# Altium schematic sheet Control-Sheet.SchDoc (part 1 of 3)
size 420 x 297 mm; SheetNumber: 4; SheetTotal: 4
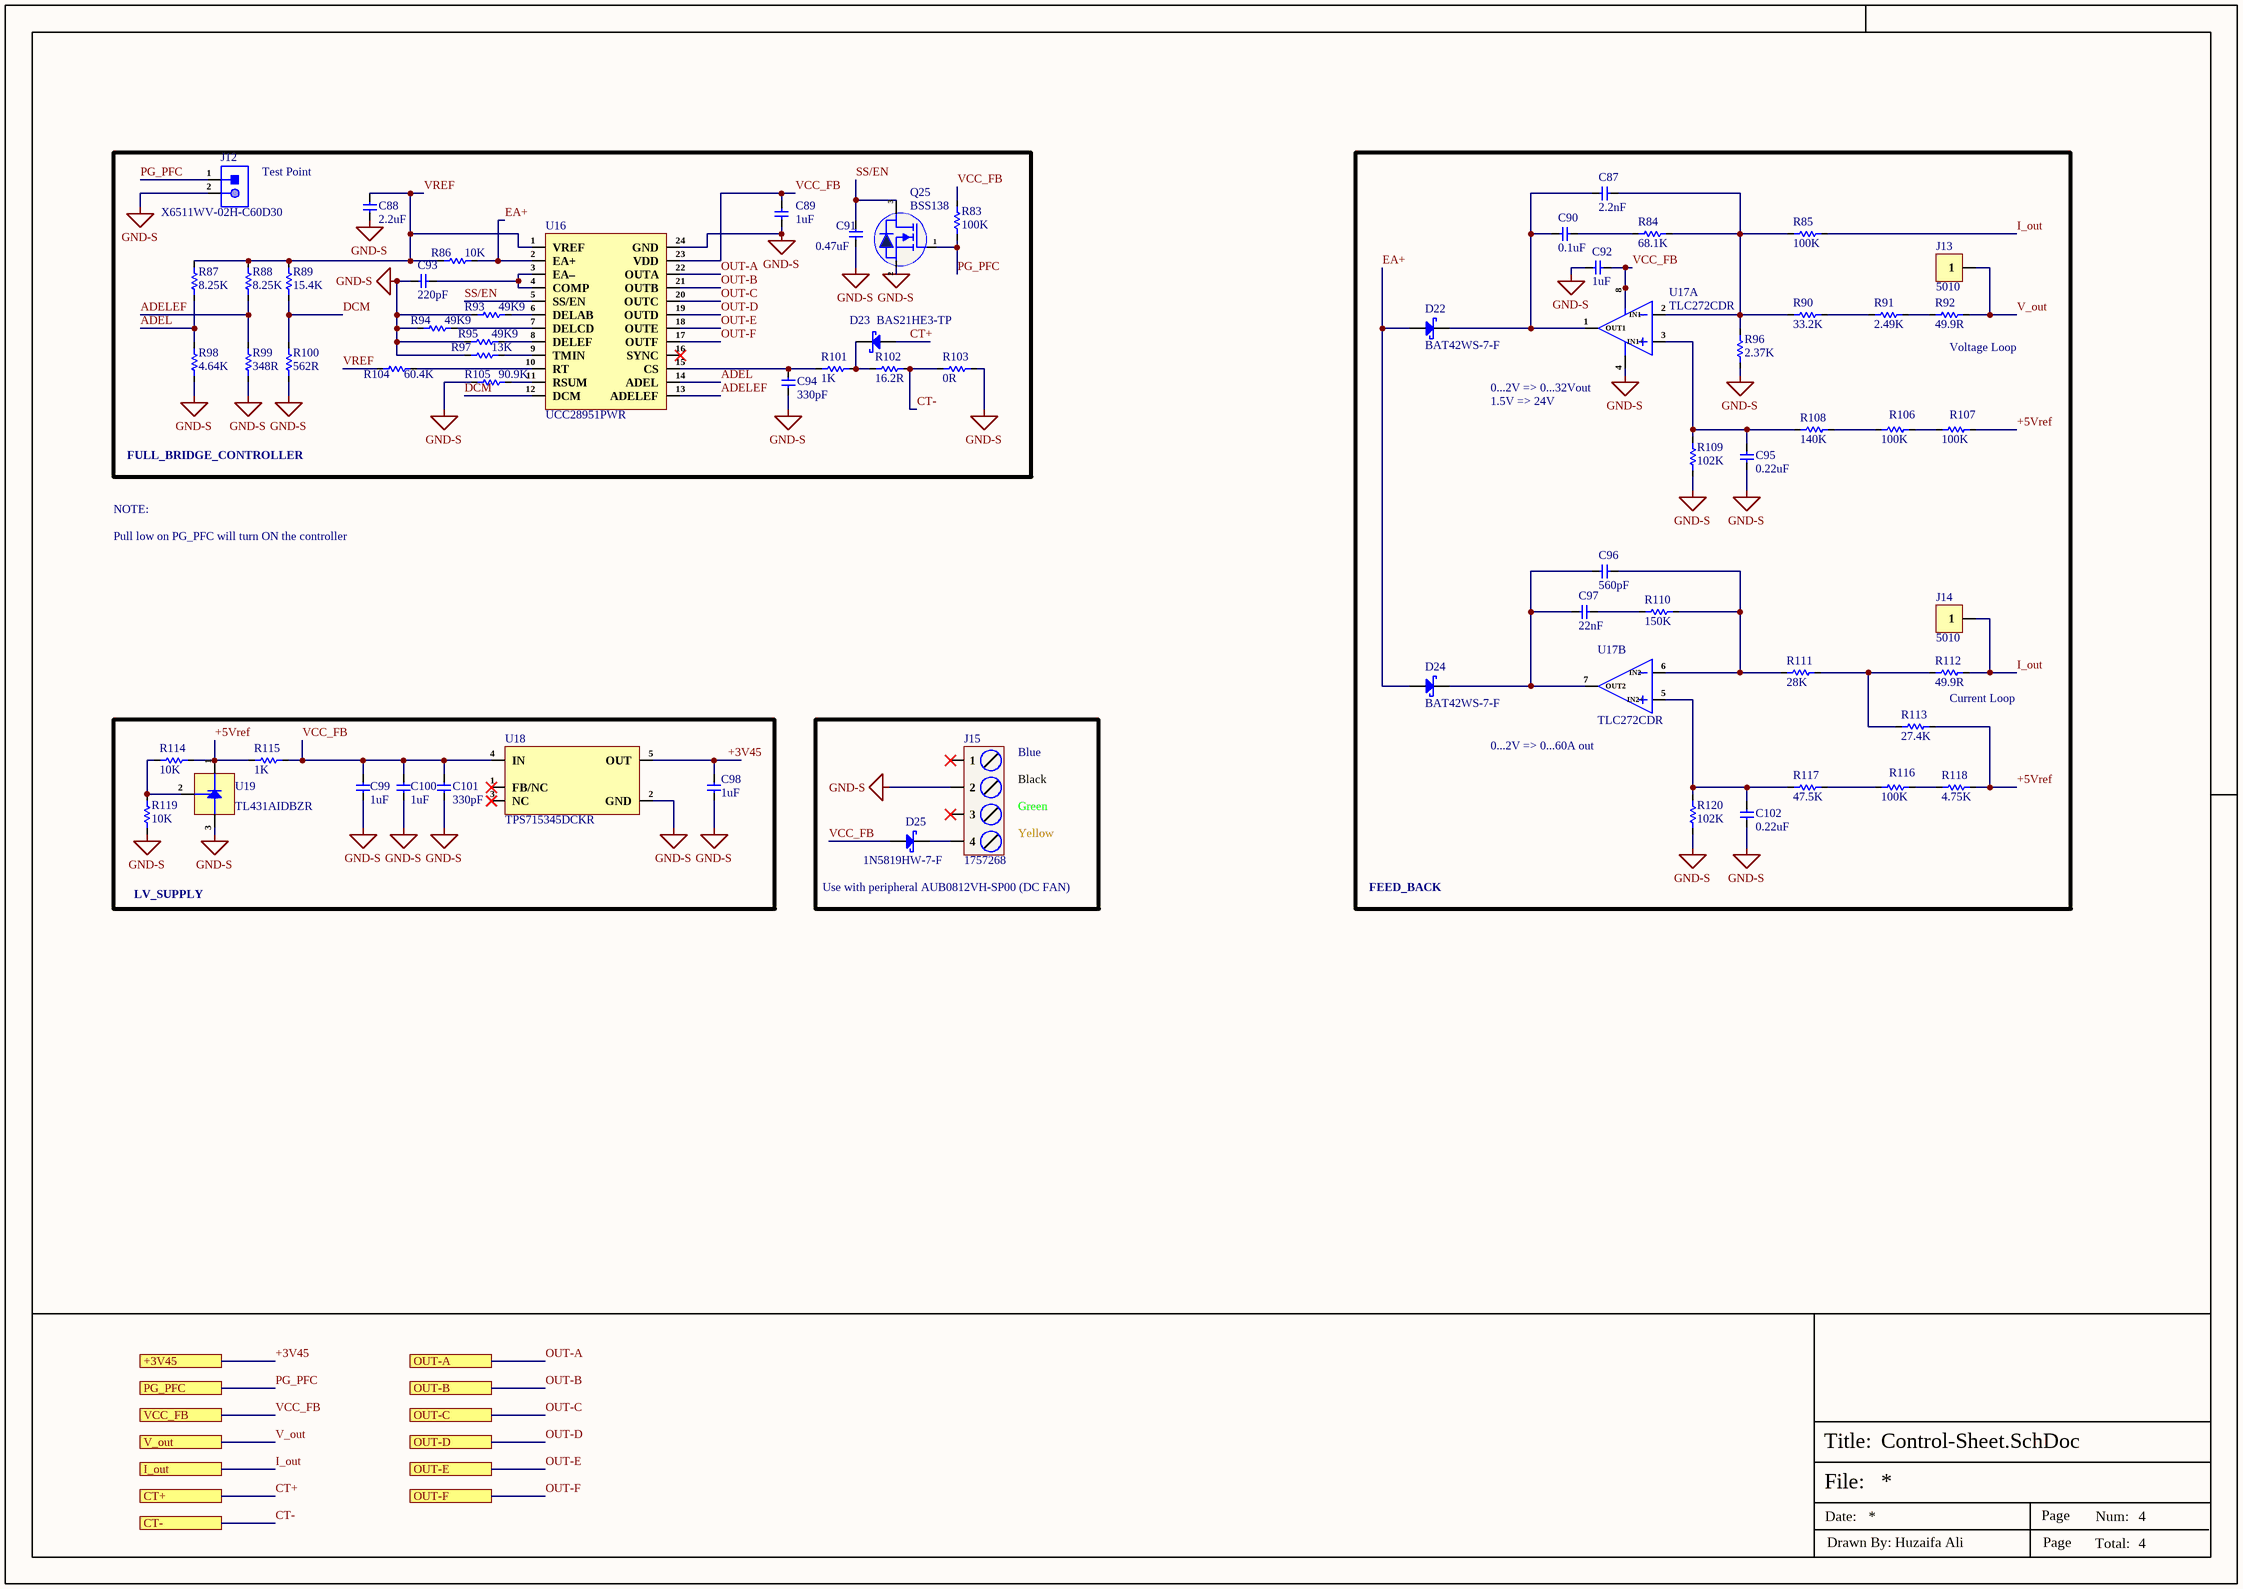
[diagram p0: Control-Sheet.SchDoc]

## Parts
C87  2.2nF  [Cap-0603]
C88  2.2uF  [Cap-0805]
C89  1uF  [Cap-0603]
C90  0.1uF  [Cap-0603]
C91  0.47uF  [Cap-0805]
C92  1uF  [Cap-0603]
C93  220pF  [Cap-0603]
C94  330pF  [Cap-0603]
C95  0.22uF  [Cap-0603]
C96  560pF  [Cap-0603]
C97  22nF  [Cap-0603]
C98  1uF  [Cap-0603]
C99  1uF  [Cap-0603]
C100  1uF  [Cap-0603]
C101  330pF  [Cap-0603]
C102  0.22uF  [Cap-0603]
D22  BAT42WS-7-F  [SOD-323]
D23  BAS21HE3-TP  [SOT-23]
D24  BAT42WS-7-F  [SOD-323]
D25  1N5819HW-7-F  [SOD-123]
J12  X6511WV-02H-C60D30  [HDR1X2_]
J13  5010  [5010]
J14  5010  [5010]
J15  1757268  [1757268]
Q25  BSS138  [Sot-23]
R83  100K  [Res-0603]
R84  68.1K  [Res-0603]
R85  100K  [Res-0603]
R86  10K  [Res-0603]
R87  8.25K  [Res-0603]
R88  8.25K  [Res-0603]
R89  15.4K  [Res-0603]
R90  33.2K  [Res-1206]
R91  2.49K  [Res-0603]
R92  49.9R  [Res-0603]
R93  49K9  [Res-0603]
R94  49K9  [Res-0603]
R95  49K9  [Res-0603]
R96  2.37K  [Res-0603]
R97  13K  [Res-0603]
R98  4.64K  [Res-0603]
R99  348R  [Res-0603]
R100  562R  [Res-0603]
R101  1K  [Res-0603]
R102  16.2R  [RES-2512]
R103  0R  [Res-1206]
R104  60.4K  [Res-0603]
R105  90.9K  [Res-0603]
R106  100K  [Res-0603]
R107  100K  [Res-0603]
R108  140K  [Res-0603]
R109  102K  [Res-0603]
R110  150K  [Res-0603]
R111  28K  [Res-0603]
R112  49.9R  [Res-0603]
R113  27.4K  [Res-0603]
R114  10K  [Res-0603]
R115  1K  [Res-0603]
R116  100K  [Res-0603]
R117  47.5K  [Res-0603]
R118  4.75K  [Res-0603]
R119  10K  [Res-0603]
R120  102K  [Res-0603]
U16  UCC28951PWR  [TSSOP-24]
U17  TLC272CDR  [SOIC-8(0.154", 3.90mm Width)]  (parts A,B of 2)
U18  TPS715345DCKR  [SC70-5]
U19  TL431AIDBZR  [SOT-23]

## Blocks framed on the sheet
LV_SUPPLY: C98-C101 R114 R115 R119 U18 U19

## Ports
+3V45 (see Top-Sheet[3C], Power-Sheet[2D]), CT+ (see Top-Sheet[3B], Power-Sheet[1D]), CT- (see Top-Sheet[3B], Power-Sheet[1D]), I_out (see Top-Sheet[3C], Power-Sheet[1D]), OUT-A (see Top-Sheet[3B], Power-Sheet[2D]), OUT-B (see Top-Sheet[3B], Power-Sheet[2D]), OUT-C (see Top-Sheet[3B], Power-Sheet[2D]), OUT-D (see Top-Sheet[3B], Power-Sheet[2D]), OUT-E (see Top-Sheet[3B], Power-Sheet[2D]), OUT-F (see Top-Sheet[3B], Power-Sheet[2D]), PG_PFC (see Top-Sheet[3C], PFC-Sheet[1D], Power-Sheet[1D]), V_out (see Top-Sheet[3B], Power-Sheet[1D]), VCC_FB (see Top-Sheet[3C], PFC-Sheet[1D], Power-Sheet[1D])

## Nets
GND-S: C88.1 C89.1 C91.1 C92.1 C93.1 C94.1 C95.1 C98.1 C99.1 C100.1 C101.1 C102.1 J12.2 J15.2 Q25.2(S) R93.1 R94.1 R95.1 R96.1 R97.1 R98.1 R99.1 R100.1 R103.2 R105.1 R109.1 R119.2 R120.1 U16.24(GND) U17.4(VDD-/GND) U18.2(GND) U19.3(Anode)
+3V45: C98.2 U18.5(OUT) ; port +3V45
+5Vref: R107.2 R113.2 R114.2 R115.1 R118.2 U19.1(Cathode)
ADEL: R87.1 R98.2 U16.14(ADEL)
ADELEF: R88.1 R99.2 U16.13(ADELEF)
CT+: D23.1(A) ; port CT+
CT-: R102.2 R103.1 ; port CT-
DCM: R89.1 R100.2 U16.12(DCM)
EA+: D22.2(A) D24.2(A) R86.2 U16.2(EA+)
I_out: J14.1 R85.2 R112.2 ; port I_out
OUT-A: U16.22(OUTA) ; port OUT-A
OUT-B: U16.21(OUTB) ; port OUT-B
OUT-C: U16.20(OUTC) ; port OUT-C
OUT-D: U16.19(OUTD) ; port OUT-D
OUT-E: U16.18(OUTE) ; port OUT-E
OUT-F: U16.17(OUTF) ; port OUT-F
PG_PFC: J12.1 Q25.1(G) R83.1 ; port PG_PFC
SS/EN: C91.2 Q25.3(D) U16.5(SS/EN)
V_out: J13.1 R92.2 ; port V_out
VCC_FB: C89.2 C92.2 C99.2 C100.2 C101.2 D25.1(A) R83.2 R115.2 U16.23(VDD) U17.8(VDD+) U18.4(IN) ; port VCC_FB
VREF: C88.2 R86.1 R87.2 R88.2 R89.2 R104.1 U16.1(VREF)
NetC87_1: C87.1 C90.2 D22.1(K) U17.1(OUT1)
NetC87_2: C87.2 R84.2 R85.1 R90.1 R96.2 U17.2(IN1-)
NetC90_1: C90.1 R84.1
NetC93_2: C93.2 U16.3(EA–) U16.4(COMP)
NetC94_2: C94.2 R101.1 U16.15(CS)
NetC95_2: C95.2 R108.1 R109.2 U17.3(IN1+)
NetC96_1: C96.1 C97.1 D24.1(K) U17.7(OUT2)
NetC96_2: C96.2 R110.2 R111.1 U17.6(IN2-)
NetC97_2: C97.2 R110.1
NetC102_2: C102.2 R117.1 R120.2 U17.5(IN2+)
NetD23_3: D23.3(K) R101.2 R102.1
NetD25_2: D25.2(K) J15.4
NetR90_2: R90.2 R91.1
NetR91_2: R91.2 R92.1
NetR93_2: R93.2 U16.6(DELAB)
NetR94_2: R94.2 U16.7(DELCD)
NetR95_2: R95.2 U16.8(DELEF)
NetR97_2: R97.2 U16.9(TMIN)
NetR104_2: R104.2 U16.10(RT)
NetR105_2: R105.2 U16.11(RSUM)
NetR106_1: R106.1 R108.2
NetR106_2: R106.2 R107.1
NetR111_2: R111.2 R112.1 R113.1
NetR114_1: R114.1 R119.1 U19.2(REF)
NetR116_1: R116.1 R117.2
NetR116_2: R116.2 R118.1

Not connected (* = marked no-connect by the designer): J15 1* 3*; U16 16(SYNC)*; U18 1(FB/NC)* 3(NC)*

## Notes on the sheet
- Test Point
- (near U17) 0...2V => 0...32Vout
- (near R92) Voltage Loop
- FULL_BRIDGE_CONTROLLER
- 1.5V => 24V
- NOTE:
- Pull low on PG_PFC will turn ON the controller
- Current Loop
- Blue
- Black
- (near U17) 0...2V => 0...60A out
- Green
- Yellow
- Use with peripheral AUB0812VH-SP00 (DC FAN)
- FEED_BACK
- File:
- Title:
- Date:
- Page
- Num:
- Total:
- Drawn By: Huzaifa Ali